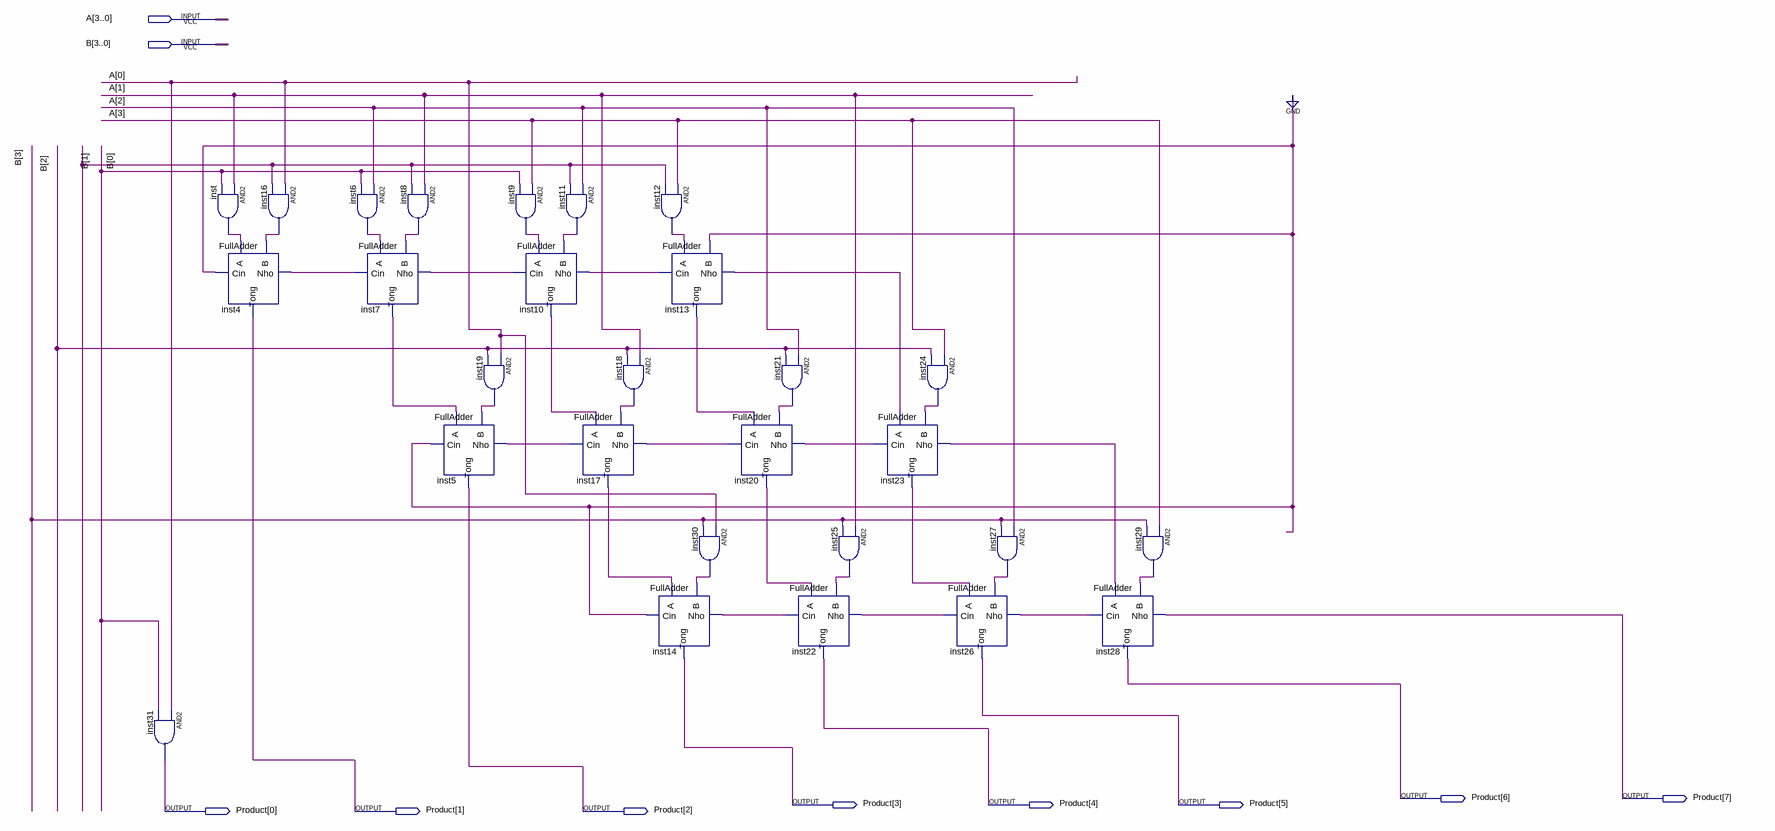
[diagram p0: schematic sheet]
// Quartus schematic cau02.bdf as structural Verilog: 28 symbols, 10 pins
module cau02 (
  input  [3:0] A,
  input  [3:0] B,
  output [7:0] Product
);

  wire inst4_nho, inst5_nho, inst6_out, inst7_nho, inst7_tong, inst8_out, inst9_out, inst10_nho, inst10_tong,
       inst11_out, inst12_out, inst13_nho, inst13_tong, inst14_nho, inst16_out, inst17_nho, inst17_tong,
       inst18_out, inst19_out, inst20_nho, inst20_tong, inst21_out, inst22_nho, inst23_nho, inst23_tong,
       inst24_out, inst25_out, inst26_nho, inst27_out, inst29_out, inst30_out, inst_out;

  and inst31 (Product[0], A[0], B[0]);
  and inst (inst_out, A[1], B[0]);
  FullAdder inst4 (.Cin(1'b0), .A(inst_out), .B(inst16_out), .Tong(Product[1]), .Nho(inst4_nho));
  and inst16 (inst16_out, A[0], B[1]);
  and inst6 (inst6_out, A[2], B[0]);
  FullAdder inst7 (.Cin(inst4_nho), .A(inst6_out), .B(inst8_out), .Tong(inst7_tong), .Nho(inst7_nho));
  and inst8 (inst8_out, A[1], B[1]);
  and inst19 (inst19_out, A[0], B[2]);
  FullAdder inst5 (.Cin(1'b0), .A(inst7_tong), .B(inst19_out), .Tong(Product[2]), .Nho(inst5_nho));
  and inst9 (inst9_out, A[3], B[0]);
  FullAdder inst10 (.Cin(inst7_nho), .A(inst9_out), .B(inst11_out), .Tong(inst10_tong), .Nho(inst10_nho));
  and inst11 (inst11_out, A[2], B[1]);
  FullAdder inst17 (.Cin(inst5_nho), .A(inst10_tong), .B(inst18_out), .Tong(inst17_tong), .Nho(inst17_nho));
  and inst18 (inst18_out, A[1], B[2]);
  and inst12 (inst12_out, A[3], B[1]);
  FullAdder inst13 (.Cin(inst10_nho), .A(inst12_out), .B(1'b0), .Tong(inst13_tong), .Nho(inst13_nho));
  FullAdder inst14 (.Cin(1'b0), .A(inst17_tong), .B(inst30_out), .Tong(Product[3]), .Nho(inst14_nho));
  FullAdder inst20 (.Cin(inst17_nho), .A(inst13_tong), .B(inst21_out), .Tong(inst20_tong), .Nho(inst20_nho));
  and inst30 (inst30_out, A[0], B[3]);
  and inst21 (inst21_out, A[2], B[2]);
  and inst25 (inst25_out, A[1], B[3]);
  FullAdder inst22 (.Cin(inst14_nho), .A(inst20_tong), .B(inst25_out), .Tong(Product[4]), .Nho(inst22_nho));
  FullAdder inst23 (.Cin(inst20_nho), .A(inst13_nho), .B(inst24_out), .Tong(inst23_tong), .Nho(inst23_nho));
  and inst24 (inst24_out, A[3], B[2]);
  FullAdder inst26 (.Cin(inst22_nho), .A(inst23_tong), .B(inst27_out), .Tong(Product[5]), .Nho(inst26_nho));
  and inst27 (inst27_out, A[2], B[3]);
  and inst29 (inst29_out, A[3], B[3]);
  FullAdder inst28 (.Cin(inst26_nho), .A(inst23_nho), .B(inst29_out), .Tong(Product[6]), .Nho(Product[7]));
endmodule
